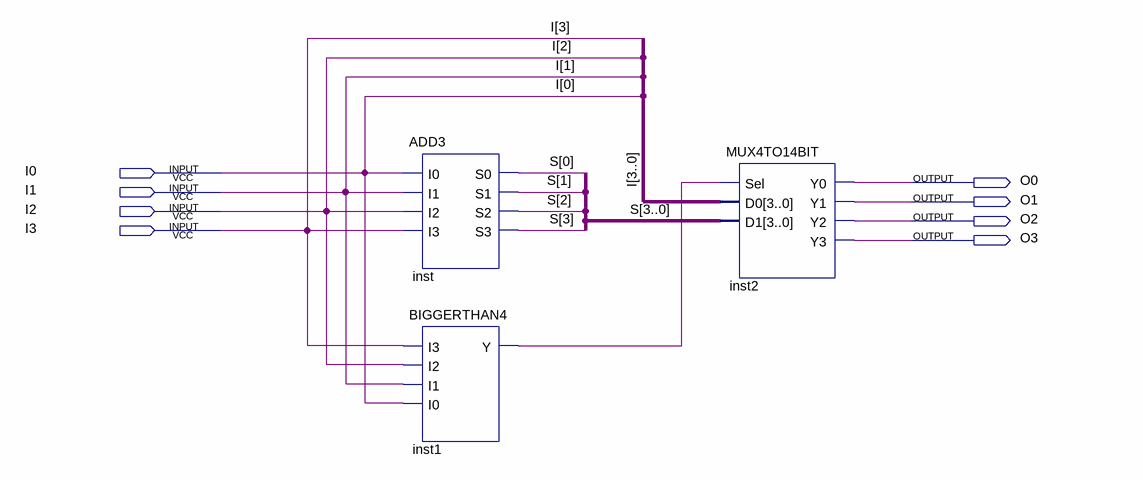
[diagram p0: schematic sheet]
// Quartus schematic CMPADD3.bdf as structural Verilog: 3 symbols, 8 pins
module CMPADD3 (
  input  I0,
  input  I1,
  input  I2,
  input  I3,
  output O0,
  output O1,
  output O2,
  output O3
);

  wire inst1_y;
  wire [3:0] S;

  ADD3 inst (.I0(I0), .I1(I1), .I2(I2), .I3(I3), .S0(S[0]), .S1(S[1]), .S2(S[2]), .S3(S[3]));
  BIGGERTHAN4 inst1 (.I3(I3), .I2(I2), .I1(I1), .I0(I0), .Y(inst1_y));
  MUX4TO14BIT inst2 (.Sel(inst1_y), .D0({I3, I2, I1, I0}), .D1(S), .Y0(O0), .Y1(O1), .Y2(O2), .Y3(O3));
endmodule
